# Altium schematic sheet 5.RGB.SchDoc
size A4; DocumentNumber: 5; SheetNumber: 5
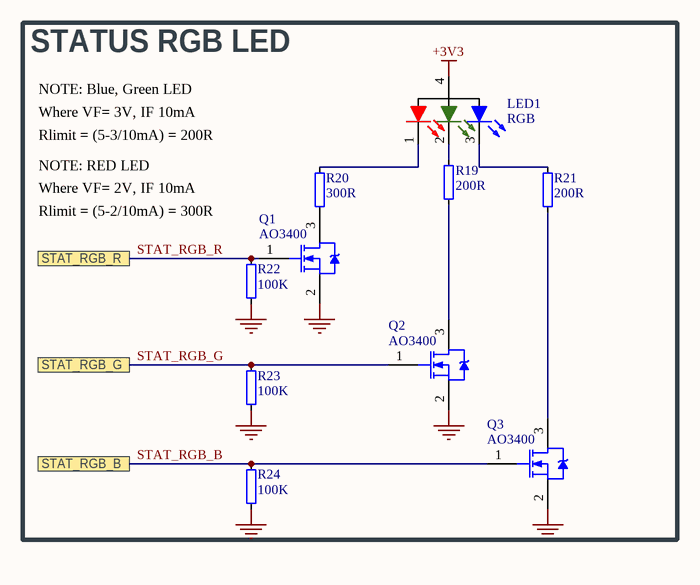
[diagram p0: 5.RGB.SchDoc]

## Parts
LED1  RGB  [LED_RGB_0606]
Q1  AO3400  [SOT-23a]
Q2  AO3400  [SOT-23a]
Q3  AO3400  [SOT-23a]
R19  200R  [RESC1005X04L]
R20  300R  [RESC1005X04L]
R21  200R  [RESC1005X04L]
R22  100K  [RESC1005X04L]
R23  100K  [RESC1005X04L]
R24  100K  [RESC1005X04L]

## Ports
STAT_RGB_B, STAT_RGB_G, STAT_RGB_R

## Nets
+3V3: LED1.4(+)
GND: Q1.2(S) Q2.2(S) Q3.2(S) R22.1 R23.1 R24.1
STAT_RGB_B: Q3.1(G) R24.2 ; port STAT_RGB_B
STAT_RGB_G: Q2.1(G) R23.2 ; port STAT_RGB_G
STAT_RGB_R: Q1.1(G) R22.2 ; port STAT_RGB_R
NetLED1_1: LED1.1(R-) R20.2
NetLED1_2: LED1.2(G-) R19.2
NetLED1_3: LED1.3(B-) R21.2
NetQ1_3: Q1.3(D) R20.1
NetQ2_3: Q2.3(D) R19.1
NetQ3_3: Q3.3(D) R21.1

## Notes on the sheet
- STATUS RGB LED
- NOTE: Blue, Green LED
- Where VF= 3V, IF 10mA
- Rlimit = (5-3/10mA) = 200R
- NOTE: RED LED
- Where VF= 2V, IF 10mA
- Rlimit = (5-2/10mA) = 300R

## Library data of the parts
LED1 = LTST-C19HE1WT: LCSC: C458749
Q1-Q3 = NMOS-2: 30V 5.8A 35mΩ@10V,5.8A 350mW N Channel SOT-23 MOSFETs ROHS; LCSC: C181090; ComponentLink1Description: Manufacturer Link; ComponentLink1URL: http://www.irf.com/
R19-R24 = R0201-10k: Resistor, ±1%, 0.05W; ComponentLink1URL: N.A.; ComponentLink1Description: Datasheet; ComponentLink2URL: N.A.; ComponentLink2Description: Supplier link; Package: 0402
  R19 R21: LCSC: C25087
  R20: LCSC: C25102
  R22-R24: LCSC: C25741